# Altium schematic sheet PA stage 1.SchDoc
size A; SheetNumber: 8; SheetTotal: 12
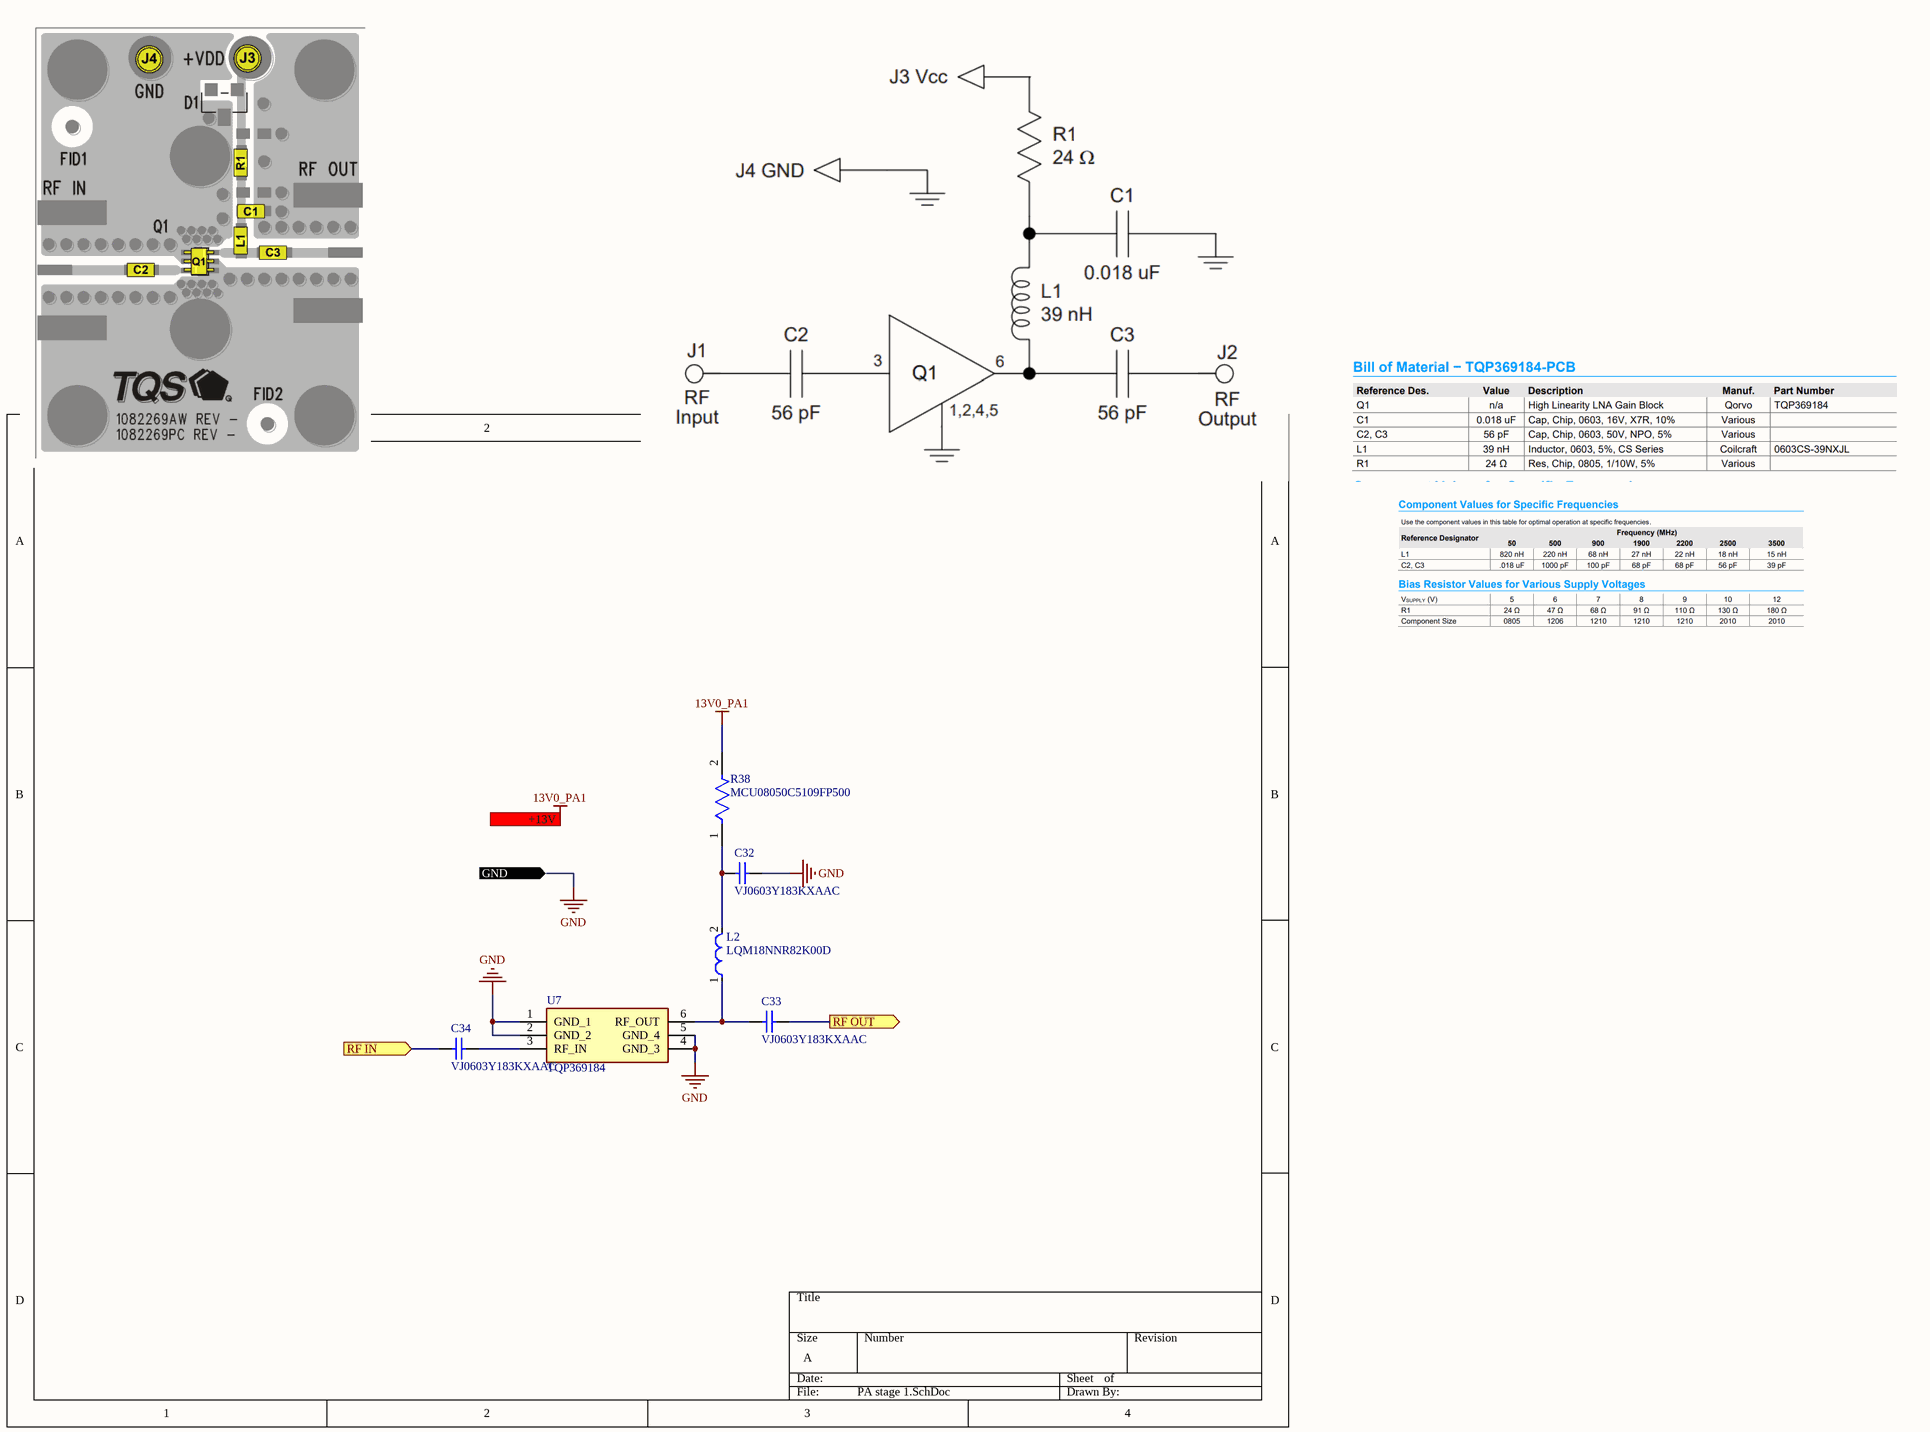
[diagram p0: PA stage 1.SchDoc]

## Parts
C32  VJ0603Y183KXAAC  [CAPC1608X92X38ML15T08]
C33  VJ0603Y183KXAAC  [CAPC1608X92X38ML15T08]
C34  VJ0603Y183KXAAC  [CAPC1608X92X38ML15T08]
L2  LQM18NNR82K00D  [FP-LQM18NN_00-IPC_B]
R38  MCU08050C5109FP500  [FP-MCU0805-IPC_C]
U7  TQP369184  [SOT65P210X110-6N]

## Ports
+13V (in), GND (in), RF IN (in), RF OUT (out)

## Nets
13V0_PA1: R38.2 ; port +13V
GND: C32.2 U7.1(GND_1) U7.2(GND_2) U7.4(GND_3) U7.5(GND_4) ; port GND
RF IN: C34.1 ; port RF IN
RF OUT: C33.2 ; port RF OUT
NetC32_1: C32.1 L2.2 R38.1
NetC33_1: C33.1 L2.1 U7.6(RF_OUT)
NetC34_2: C34.2 U7.3(RF_IN)

## Library data of the parts
C32-C34 = CMP-2006-01326-1: Manufacturer: Vitramon; Part Number: VJ0603Y183KXAAC
L2 = CMP-06042-016197-1: Multilayer Type Inductor for General Circuits, 0603 (1608), 820nH, 10%, 2.1Ω, 35mA; Self Resonant Frequency: 85MHz; Shielding: Shielded; DC Resistance (DCR): 2.1R; Test Frequency: 25MHz; Core Material: Ferrite; Q Factor: 15; RoHS Compliant: Yes; Length: 1.6mm; Max Operating Temperature: 85°C; Case Code (Metric): 1608; Lead Free: Lead Free; Package Quantity: 1; Series: LQM18N; Height - Seated (Max): 0.037inch; Current Rating: 35mA; Radiation Hardening: No; REACH SVHC: No SVHC; Termination: SMD/SMT; Case Code (Imperial): 0603; Width: 0.031inch; Height: 0.8mm; Tolerance: 10%; Military Standard: Not; Mount: Surface Mount; Max DC Current: 35mA; Depth: 0.95mm; Inductance: 820nH; Min Operating Temperature: -40°C; DC Current: 35mA; Case/Package: 0603; Packaging: Tape and Reel
R38 = CMP-02407-000931-1: RES 1.05K OHM 0.5% 1/5W 0805; Tolerance: 1%; Resistance: 51R; Temperature Coefficient: 50ppm/°C; Length: 2mm; Min Operating Temperature: -55°C; Lead Free: Lead Free; Contact Plating: Tin; Case/Package: 0805; Radiation Hardening: No; Max Operating Temperature: 125°C; Width: 1.25mm; Height: 450um; Composition: Thin Film
U7 = TQP369184: DC  6 GHz Gain Block; Manufacturer_Name: Qorvo; Geometry.Height: 1.1mm; Mouser Part Number: 772-TQP369184; Mouser Price/Stock: https://www.mouser.co.uk/ProductDetail/Qorvo/TQP369184?qs=opBjA1TV900HByuIeJCWsQ%3D%3D; Manufacturer_Part_Number: TQP369184; Datasheet Link: https://www.qorvo.com/products/d/da005471